# EAGLE design mbc_90_23_11_25_ac (EAGLE 7.6.0)

## Sheet 1 of 2
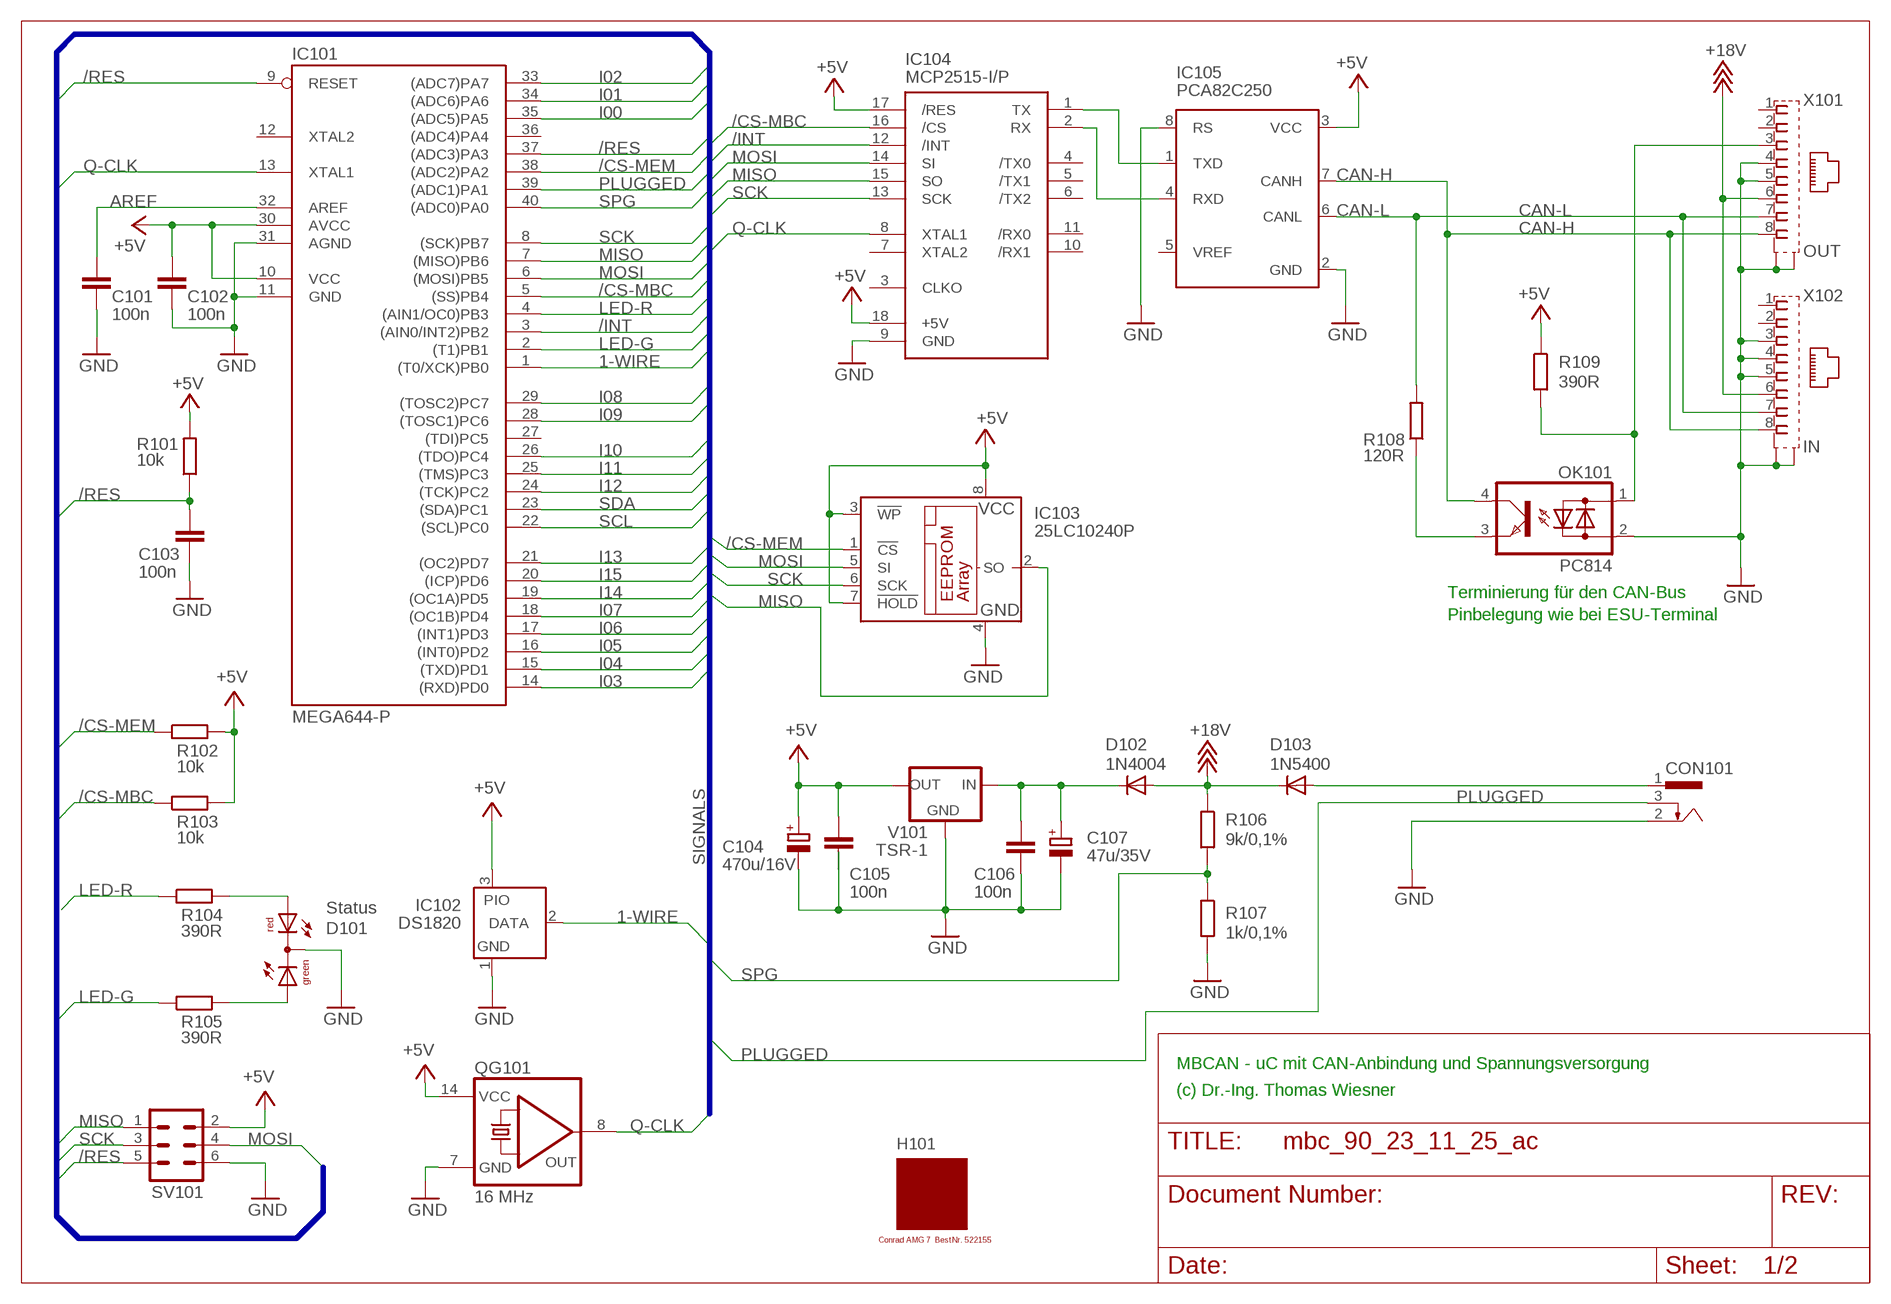
[diagram p0: schematic, sheet 1]

### Parts
C101  100n  C-EU025-025X050  [C025-025X050]
C102  100n  C-EU025-025X050  [C025-025X050]
C103  100n  C-EU025-025X050  [C025-025X050]
C104  470u/16V  CPOL-EUE3.5-8  [E3,5-8]
C105  100n  C-EU025-025X050  [C025-025X050]
C106  100n  C-EU025-025X050  [C025-025X050]
C107  47u/35V  CPOL-EUE2.5-7  [E2,5-7]
CON101  POWER-JACK  [POWER-JACK]
D101  Status  DUOLED5MM  [DUOLED5MM]
D102  1N4004  [DO41-10]
D103  1N5400  [DO201-15]
H101  MODULGEHÄUSE-AMG-7  [MODULGEHÄUSE-1]
IC101  MEGA644-P  MEGA323-P  [DIL40]
IC102  DS1820  DS2405  [TO92-]
IC103  25LC10240P  25LC040P  [DIL8]
IC104  MCP2515-I/P  MCP2510-I/P  [DIL18]
IC105  PCA82C250  [DIL08]
OK101  PC814  [DIL04]
QG101  16 MHz  QG5860  [DIL14S]
R101  10k  R-EU_0207/10  [0207/10]
R102  10k  R-EU_0207/10  [0207/10]
R103  10k  R-EU_0207/10  [0207/10]
R104  390R  R-EU_0207/10  [0207/10]
R105  390R  R-EU_0207/10  [0207/10]
R106  9k/0,1%  R-EU_0207/10  [0207/10]
R107  1k/0,1%  R-EU_0207/10  [0207/10]
R108  120R  R-EU_0207/10  [0207/10]
R109  390R  R-EU_0207/10  [0207/10]
SV101  ML6  [ML6]
V101  TSR-1  [TRACO-TSR-1]
X101  OUT  0446200002  [0446200002]
X102  IN  0446200002  [0446200002]

### Nets
1-WIRE: IC101.1((T0/XCK)PB0) IC102.2(DATA)
+5V: C102.1 C104.+ C105.1 IC101.10(VCC) IC101.30(AVCC) IC102.3(PIO) IC103.3(!WP) IC103.7(!HOLD) IC103.8(VCC) IC104.17(/RES) IC104.18(+5V) IC105.3(VCC) QG101.14(VCC) R101.2 R102.2 R103.2 R109.1 SV101.2 V101.OUT ; also sheet 2
+18V: D102.A D103.C R106.1 X101.6 X102.6
/CS-MBC: IC101.5((SS)PB4) IC104.16(/CS) R103.1
/CS-MEM: IC101.38((ADC2)PA2) IC103.1(!CS) R102.1
/INT: IC101.3((AIN0/INT2)PB2) IC104.12(/INT)
/RES: C103.1 IC101.9(RESET) IC101.37((ADC3)PA3) R101.1 SV101.5
AREF: C101.1 IC101.32(AREF)
CAN-H: IC105.7(CANH) OK101.4(C) X101.8 X102.8
CAN-L: IC105.6(CANL) R108.2 X101.7 X102.7
GND: C101.2 C102.2 C103.2 C104.- C105.2 C106.2 C107.- CON101.2 D101.K(C) IC101.11(GND) IC101.31(AGND) IC102.1(GND) IC103.4(GND) IC104.9(GND) IC105.2(GND) IC105.8(RS) QG101.7(GND) R107.2 SV101.6 V101.GND X101.4 X101.5 X101.S@1(S1) X101.S@2(S2) X102.3 X102.4 X102.5 X102.S@1(S1) X102.S@2(S2) ; also sheet 2
I00: IC101.35((ADC5)PA5) ; also sheet 2
I01: IC101.34((ADC6)PA6) ; also sheet 2
I02: IC101.33((ADC7)PA7) ; also sheet 2
I03: IC101.14((RXD)PD0) ; also sheet 2
I04: IC101.15((TXD)PD1) ; also sheet 2
I05: IC101.16((INT0)PD2) ; also sheet 2
I06: IC101.17((INT1)PD3) ; also sheet 2
I07: IC101.18((OC1B)PD4) ; also sheet 2
I08: IC101.29((TOSC2)PC7) ; also sheet 2
I09: IC101.28((TOSC1)PC6) ; also sheet 2
I10: IC101.26((TDO)PC4) ; also sheet 2
I11: IC101.25((TMS)PC3) ; also sheet 2
I12: IC101.24((TCK)PC2) ; also sheet 2
I13: IC101.21((OC2)PD7) ; also sheet 2
I14: IC101.19((OC1A)PD5) ; also sheet 2
I15: IC101.20((ICP)PD6) ; also sheet 2
LED-G: IC101.2((T1)PB1) R105.1
LED-R: IC101.4((AIN1/OC0)PB3) R104.1
MISO: IC101.7((MISO)PB6) IC103.2(SO) IC104.15(SO) SV101.1
MOSI: IC101.6((MOSI)PB5) IC103.5(SI) IC104.14(SI) SV101.4
N$1: IC104.1(TX) IC105.1(TXD)
N$2: IC104.2(RX) IC105.4(RXD)
N$4: OK101.3(E) R108.1
N$6: C106.1 C107.+ D102.C V101.IN
N$7: OK101.1(AC1) R109.2 X101.3
N$9: D101.AR R104.2
N$13: D101.AG R105.2
PLUGGED: CON101.3 IC101.39((ADC1)PA1)
Q-CLK: IC101.13(XTAL1) IC104.8(XTAL1) QG101.8(OUT)
SCK: IC101.8((SCK)PB7) IC103.6(SCK) IC104.13(SCK) SV101.3
SCL: IC101.22((SCL)PC0) ; also sheet 2
SDA: IC101.23((SDA)PC1) ; also sheet 2
SPG: IC101.40((ADC0)PA0) R106.2 R107.1
V-NETZTEIL1: CON101.1 D103.A
Unconnected: IC101.12(XTAL2) IC101.27((TDI)PC5) IC101.36((ADC4)PA4) IC104.3(CLKO) IC104.4(/TX0) IC104.5(/TX1) IC104.6(/TX2) IC104.7(XTAL2) IC104.10(/RX1) IC104.11(/RX0) IC105.5(VREF) OK101.2(AC2) X101.1 X101.2 X102.1 X102.2

### Buses
SIGNALS

### Notes on the sheet
- Terminierung für den CAN-Bus
- Pinbelegung wie bei ESU-Terminal
- MBCAN - uC mit CAN-Anbindung und Spannungsversorgung
- (c) Dr.-Ing. Thomas Wiesner

## Sheet 2 of 2
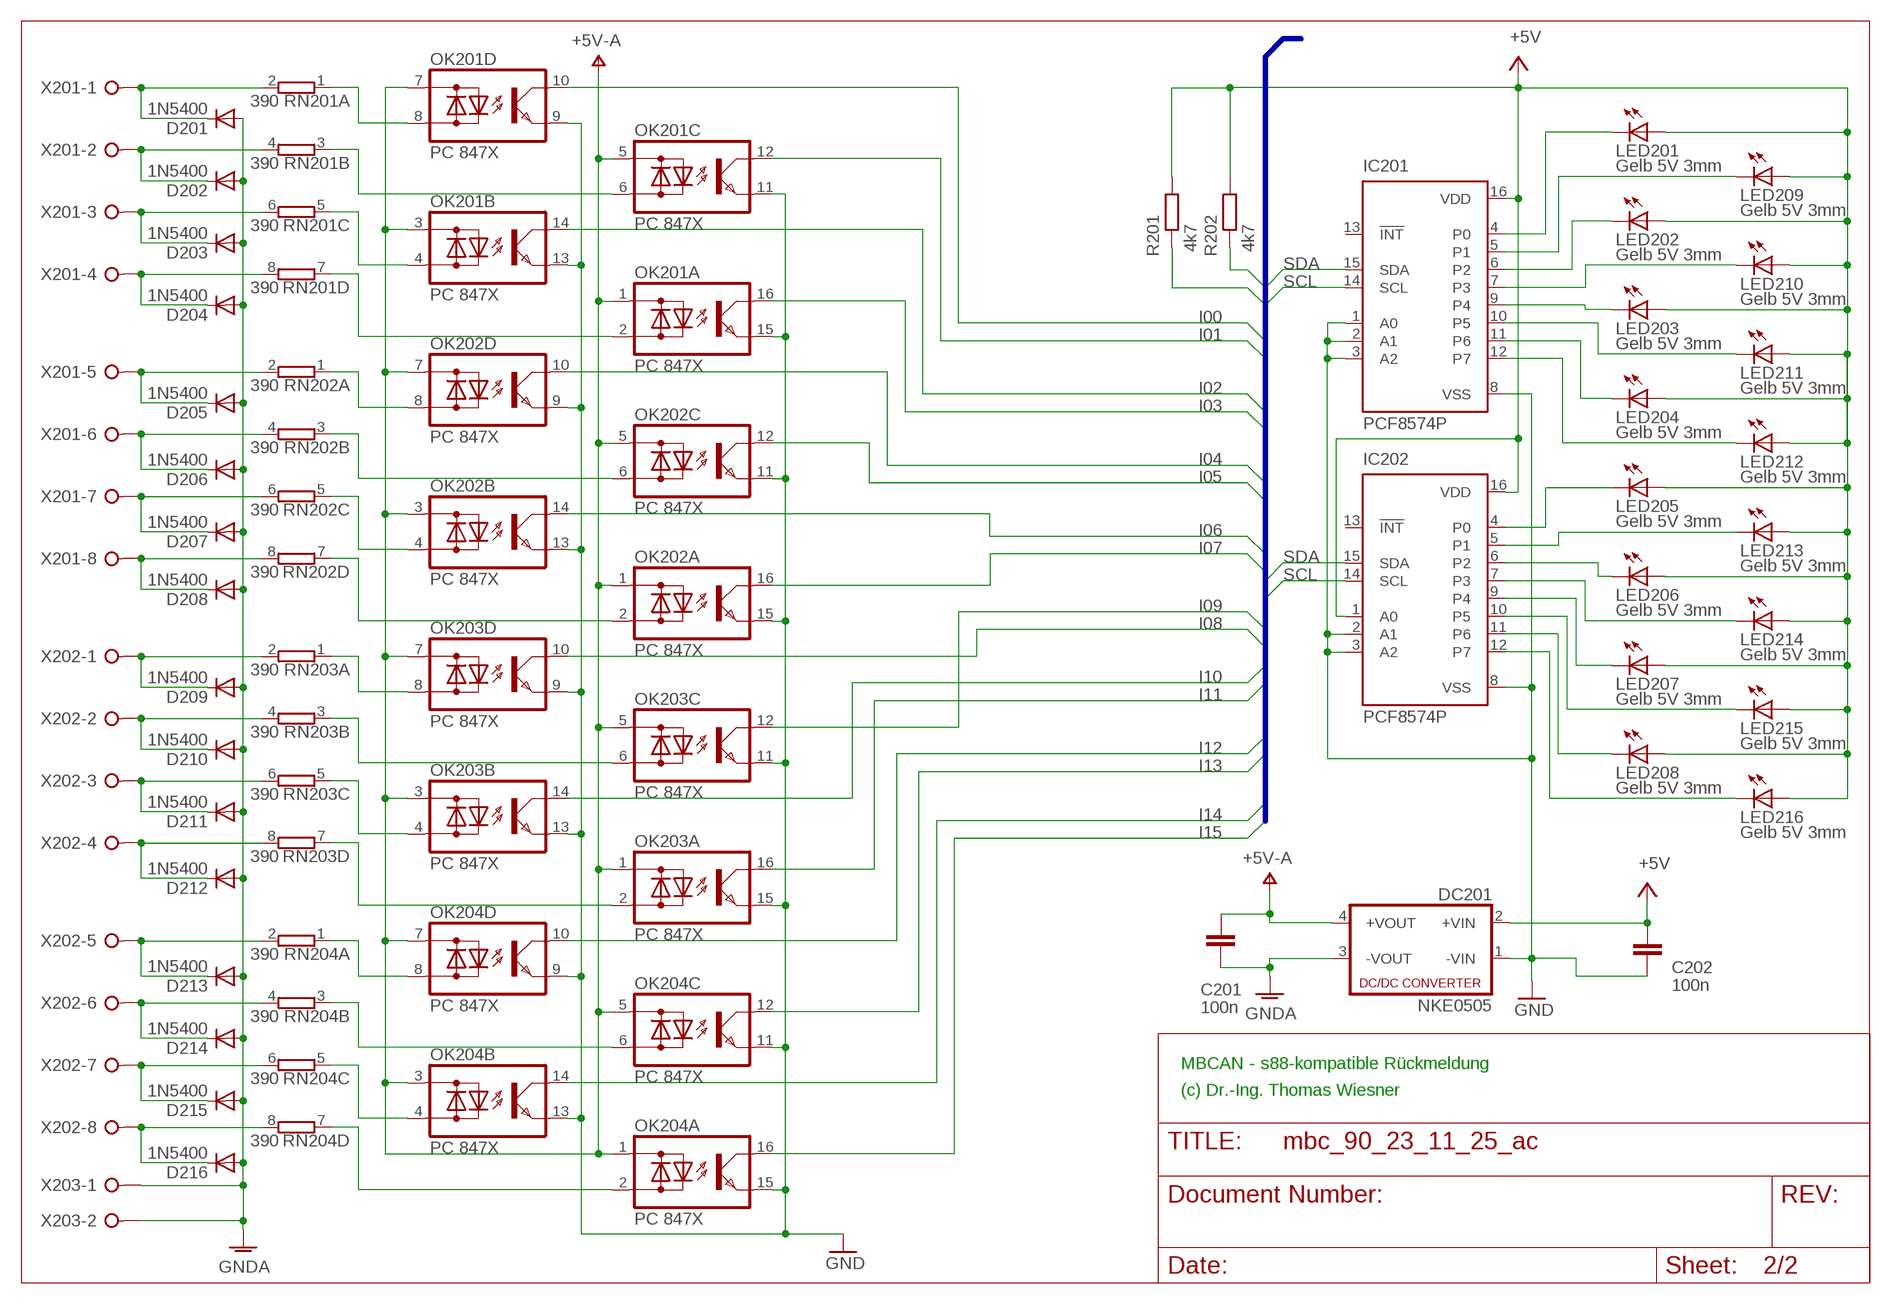
[diagram p1: schematic, sheet 2]

### Parts
C201  100n  C-EU025-025X050  [C025-025X050]
C202  100n  C-EU025-025X050  [C025-025X050]
D201  1N5400  [DO201-15]
D202  1N5400  [DO201-15]
D203  1N5400  [DO201-15]
D204  1N5400  [DO201-15]
D205  1N5400  [DO201-15]
D206  1N5400  [DO201-15]
D207  1N5400  [DO201-15]
D208  1N5400  [DO201-15]
D209  1N5400  [DO201-15]
D210  1N5400  [DO201-15]
D211  1N5400  [DO201-15]
D212  1N5400  [DO201-15]
D213  1N5400  [DO201-15]
D214  1N5400  [DO201-15]
D215  1N5400  [DO201-15]
D216  1N5400  [DO201-15]
DC201  NKE0505  NME  [NME]
IC201  PCF8574P  [DIL16]
IC202  PCF8574P  [DIL16]
LED201  Gelb 5V 3mm  LED3MM  [LED3MM]
LED202  Gelb 5V 3mm  LED3MM  [LED3MM]
LED203  Gelb 5V 3mm  LED3MM  [LED3MM]
LED204  Gelb 5V 3mm  LED3MM  [LED3MM]
LED205  Gelb 5V 3mm  LED3MM  [LED3MM]
LED206  Gelb 5V 3mm  LED3MM  [LED3MM]
LED207  Gelb 5V 3mm  LED3MM  [LED3MM]
LED208  Gelb 5V 3mm  LED3MM  [LED3MM]
LED209  Gelb 5V 3mm  LED3MM  [LED3MM]
LED210  Gelb 5V 3mm  LED3MM  [LED3MM]
LED211  Gelb 5V 3mm  LED3MM  [LED3MM]
LED212  Gelb 5V 3mm  LED3MM  [LED3MM]
LED213  Gelb 5V 3mm  LED3MM  [LED3MM]
LED214  Gelb 5V 3mm  LED3MM  [LED3MM]
LED215  Gelb 5V 3mm  LED3MM  [LED3MM]
LED216  Gelb 5V 3mm  LED3MM  [LED3MM]
OK201  PC 847X  TIL196  [DIL16]
OK202  PC 847X  TIL196  [DIL16]
OK203  PC 847X  TIL196  [DIL16]
OK204  PC 847X  TIL196  [DIL16]
R201  4k7  R-EU_0207/10  [0207/10]
R202  4k7  R-EU_0207/10  [0207/10]
RN201  390  E4R  [SIL8]
RN202  390  E4R  [SIL8]
RN203  390  E4R  [SIL8]
RN204  390  E4R  [SIL8]
X201  W237-08P  [W237-8P]
X202  W237-08P  [W237-8P]
X203  W237-02P  [W237-132]

### Nets
+5V: C202.1 DC201.2(+VIN) IC201.16(VDD) IC202.1(A0) IC202.16(VDD) LED201.A LED202.A LED203.A LED204.A LED205.A LED206.A LED207.A LED208.A LED209.A LED210.A LED211.A LED212.A LED213.A LED214.A LED215.A LED216.A R201.2 R202.2 ; also sheet 1
GND: C202.2 DC201.1(-VIN) IC201.1(A0) IC201.2(A1) IC201.3(A2) IC201.8(VSS) IC202.2(A1) IC202.3(A2) IC202.8(VSS) OK201.9(D:E) OK201.11(C:E) OK201.13(B:E) OK201.15(A:E) OK202.9(D:E) OK202.11(C:E) OK202.13(B:E) OK202.15(A:E) OK203.9(D:E) OK203.11(C:E) OK203.13(B:E) OK203.15(A:E) OK204.9(D:E) OK204.11(C:E) OK204.13(B:E) OK204.15(A:E) ; also sheet 1
GNDA: C201.2 D201.A D202.A D203.A D204.A D205.A D206.A D207.A D208.A D209.A D210.A D211.A D212.A D213.A D214.A D215.A D216.A DC201.3(-VOUT) X203.1 X203.2
I00: OK201.10(D:C) ; also sheet 1
I01: OK201.12(C:C) ; also sheet 1
I02: OK201.14(B:C) ; also sheet 1
I03: OK201.16(A:C) ; also sheet 1
I04: OK202.10(D:C) ; also sheet 1
I05: OK202.12(C:C) ; also sheet 1
I06: OK202.14(B:C) ; also sheet 1
I07: OK202.16(A:C) ; also sheet 1
I08: OK203.10(D:C) ; also sheet 1
I09: OK203.12(C:C) ; also sheet 1
I10: OK203.14(B:C) ; also sheet 1
I11: OK203.16(A:C) ; also sheet 1
I12: OK204.10(D:C) ; also sheet 1
I13: OK204.12(C:C) ; also sheet 1
I14: OK204.14(B:C) ; also sheet 1
I15: OK204.16(A:C) ; also sheet 1
N$15: IC201.9(P4) LED203.K(C)
N$16: D215.C RN204.6 X202.7
N$17: D216.C RN204.8 X202.8
N$18: D213.C RN204.2 X202.5
N$19: D214.C RN204.4 X202.6
N$20: D211.C RN203.6 X202.3
N$21: D212.C RN203.8 X202.4
N$22: D209.C RN203.2 X202.1
N$23: D210.C RN203.4 X202.2
N$24: D207.C RN202.6 X201.7
N$25: D208.C RN202.8 X201.8
N$26: D205.C RN202.2 X201.5
N$27: D206.C RN202.4 X201.6
N$28: D203.C RN201.6 X201.3
N$29: D204.C RN201.8 X201.4
N$30: D201.C RN201.2 X201.1
N$31: IC201.10(P5) LED211.K(C)
N$32: OK204.2(A:AC2) RN204.7
N$35: OK204.4(B:AC2) RN204.5
N$36: OK204.6(C:AC2) RN204.3
N$37: OK204.8(D:AC2) RN204.1
N$38: OK203.2(A:AC2) RN203.7
N$39: OK203.4(B:AC2) RN203.5
N$40: OK203.6(C:AC2) RN203.3
N$41: OK203.8(D:AC2) RN203.1
N$42: OK202.2(A:AC2) RN202.7
N$43: OK202.4(B:AC2) RN202.5
N$44: OK202.6(C:AC2) RN202.3
N$45: OK202.8(D:AC2) RN202.1
N$46: OK201.2(A:AC2) RN201.7
N$47: D202.C RN201.4 X201.2
N$48: OK201.4(B:AC2) RN201.5
N$49: IC202.4(P0) LED205.K(C)
N$50: IC201.4(P0) LED201.K(C)
N$51: IC201.5(P1) LED209.K(C)
N$52: IC201.6(P2) LED202.K(C)
N$53: IC201.7(P3) LED210.K(C)
N$54: IC201.11(P6) LED204.K(C)
N$55: IC201.12(P7) LED212.K(C)
N$56: IC202.9(P4) LED207.K(C)
N$57: IC202.5(P1) LED213.K(C)
N$58: IC202.6(P2) LED206.K(C)
N$59: IC202.7(P3) LED214.K(C)
N$60: IC202.10(P5) LED215.K(C)
N$61: IC202.11(P6) LED208.K(C)
N$62: IC202.12(P7) LED216.K(C)
N$64: OK201.6(C:AC2) RN201.3
N$65: OK201.8(D:AC2) RN201.1
SCL: IC201.14(SCL) IC202.14(SCL) R201.1 ; also sheet 1
SDA: IC201.15(SDA) IC202.15(SDA) R202.1 ; also sheet 1
V+: C201.1 DC201.4(+VOUT) OK201.1(A:AC1) OK201.3(B:AC1) OK201.5(C:AC1) OK201.7(D:AC1) OK202.1(A:AC1) OK202.3(B:AC1) OK202.5(C:AC1) OK202.7(D:AC1) OK203.1(A:AC1) OK203.3(B:AC1) OK203.5(C:AC1) OK203.7(D:AC1) OK204.1(A:AC1) OK204.3(B:AC1) OK204.5(C:AC1) OK204.7(D:AC1) ; supply symbol labelled +5V-A
Unconnected: IC201.13(!INT) IC202.13(!INT)

### Buses
B$1

### Notes on the sheet
- MBCAN - s88-kompatible Rückmeldung
- (c) Dr.-Ing. Thomas Wiesner

## Library data of the parts
C101-C103 C105 C106 C201 C202 = rcl:C-EU: CAPACITOR, European symbol
C104 C107 = rcl:CPOL-EU: POLARIZED CAPACITOR, European symbol
CON101 = mbc:POWER-JACK: Power-Stecker für 2,5 mm Hohlbuchse
D101 = led:DUOLED5MM: DUO LED 2 colors, 5 mm, round
D102 = diode:1N4004: DIODE general purpose rectifier, 1 A
D103 D201-D216 = diode:1N5400: DIODE standard rectifier, 3 A, 50 V (Motorola)
DC201 = dc-dc-converter:NME: DC-DC CONVERTER; MF: C & D TECHNOLOGIES, INC; MPN: NME1205D; OC_FARNELL: 1021466; OC_NEWARK: 98B8198
H101 = mbc:MODULGEHÄUSE-AMG-7: Gehäuse Conrad AMG 7 BestNr. 522155
IC101 = atmel:MEGA323-P: MICROCONTROLLER 32 Kbytes FLASH 2 Kbytes SRAM 1 Kbytes EEPROM USART 8-channel 10 bit ADC Source: avr.lbr; OC_FARNELL: unknown; OC_NEWARK: unknown
IC102 = maxim:DS2405: Addressable Switch DALLAS Semiconductor; MF: DALLAS SEMICONDUCTOR; MPN: DS2405; OC_FARNELL: 1188025; OC_NEWARK: 06F4645
IC103 = microchip:25*: Serial EEPROM 4K/ 8K , SPI bus; MF: MICROCHIP; MPN: 25LC040/P; OC_FARNELL: 9758100; OC_NEWARK: 96K4091
IC104 = mbc:MCP2510: BASIC-CAN 2.0a Controller Stand-alone CAN controller von Microchip
IC105 = micro-philips:PCA82C250: CAN CONTROLLER INTERFACE; OC_FARNELL: 3692358; OC_NEWARK: unknown
IC201 IC202 = micro-philips:PCF8574: I2C-Bus Remote 8-bit I/O expander http://www.semiconductors.philips.com/acrobat_download/datasheets/PCF8574_4.pdf; MPN: PCF8574PN; OC_FARNELL: 204020; OC_NEWARK: 11N8515
LED201-LED216 = led:LED: LED OSRAM: - CHIPLED LG R971, LG N971, LY N971, LG Q971, LY Q971, LO R971, LY R971 LH N974, LH R974 LS Q976, LO Q976, LY Q976 LO Q996 - Hyper CHIPLED LW Q18S LB Q993, LB Q99A, LB R99A - SideLED LS A670, LO A670, LY A670, LG A670, LP A670 LB A673, LV A673, LT A673, LW A673 LH A674 LY A675 LS A676, LA A676, LO A676, LY A676, LW A676 LS A679, LY A679, LG A679 - Hyper Micro SIDELED® LS Y876, LA Y876, LO Y876, LY Y876 LT Y87S - SmartLED LW L88C, LW L88S LB L89C, LB L89S, LG L890 LS L89K, LO L89K, LY L89K LS L896, LA L896, LO L896, LY L896 - TOPLED LS T670, LO T670, LY T670, LG T670, LP T670 LSG T670, LSP T670, LSY T670, LOP T670, LYG T670 LG T671, LOG T671, LSG T671 LB T673, LV T673, LT T673, LW T673 LH T674 LS T676, LA T676, LO T676, LY T676, LB T676, LH T676, LSB T676, LW T676 LB T67C, LV T67C, LT T67C, LS T67K, LO T67K, LY T67K, LW E67C LS E67B, LA E67B, LO E67B, LY E67B, LB E67C, LV E67C, LT E67C LW T67C LS T679, LY T679, LG T679 LS T770, LO T770, LY T770, LG T770, LP T770 LB T773, LV T773, LT T773, LW T773 LH T774 LS E675, LA E675, LY E675, LS T675 LS T776, LA T776, LO T776, LY T776, LB T776 LHGB T686 LT T68C, LB T68C - Hyper Mini TOPLED® LB M676 - Mini TOPLED Santana® LG M470 LS M47K, LO M47K, LY M47K Source: http://www.osram.convergy.de LUXEON: - LUMILED® LXK2-PW12-R00, LXK2-PW12-S00, LXK2-PW14-U00, LXK2-PW14-V00 LXK2-PM12-R00, LXK2-PM12-S00, LXK2-PM14-U00 LXK2-PE12-Q00, LXK2-PE12-R00, LXK2-PE12-S00, LXK2-PE14-T00, LXK2-PE14-U00 LXK2-PB12-K00, LXK2-PB12-L00, LXK2-PB12-M00, LXK2-PB14-N00, LXK2-PB14-P00, LXK2-PB14-Q00 LXK2-PR12-L00, LXK2-PR12-M00, LXK2-PR14-Q00, LXK2-PR14-R00 LXK2-PD12-Q00, LXK2-PD12-R00, LXK2-PD12-S00 LXK2-PH12-R00, LXK2-PH12-S00 LXK2-PL12-P00, LXK2-PL12-Q00, LXK2-PL12-R00 Source: www.luxeon.com KINGBRIGHT: KA-3528ASYC Source: www.kingbright.com
OK101 = optocoupler:PC814: SHARP OPTO COUPLER; OC_FARNELL: 9707662; OC_NEWARK: unknown
OK201-OK204 = optocoupler:TIL196: TEXAS INSTRUMENTS OPTO COUPLER; MPN: TIL 196; OC_FARNELL: 1683367; OC_NEWARK: 05R6476
QG101 = crystal:QG5860: CRYSTAL RESONATOR; OC_FARNELL: unknown; OC_NEWARK: unknown
R101-R109 R201 R202 = resistor:R-EU_: RESISTOR, European symbol
RN201-RN204 = resistor-sil:E4R: SIL RESISTOR; OC_FARNELL: unknown; OC_NEWARK: unknown
SV101 = con-ml:ML6: HARTING; OC_FARNELL: unknown; OC_NEWARK: unknown
V101 = mbc:TSR-1: Spannungsregler Hersteller: TRACO Typ: TSR-1 5V: TSR 1-2450 Spg: 5V Strom: 1A Reichelt TSR 1-2450
X101 X102 = mbc:0446200002: RJ-45 INVERTED MODULAR JACK ASSEMBLY WITH RJ-11 KEEPOUT FEATURE Source: Data sheet <http://www.farnell.com/datasheets/73207.pdf> MOLEX 0446200002 BUCHSE, RJ45, GESCHIRMT Source: Farnell <http://de.farnell.com/molex/0446200002/buchse-rj45-geschirmt/dp/9251910?ost=9251910>; MF: MOLEX; MPN: 0446200002; OC_FARNELL: 9251910
X201 X202 = con-wago-508:W237-08P: WAGO SREW CLAMP; OC_FARNELL: unknown; OC_NEWARK: unknown
X203 = con-wago-508:W237-02P: WAGO SREW CLAMP; OC_FARNELL: unknown; OC_NEWARK: unknown

## Board
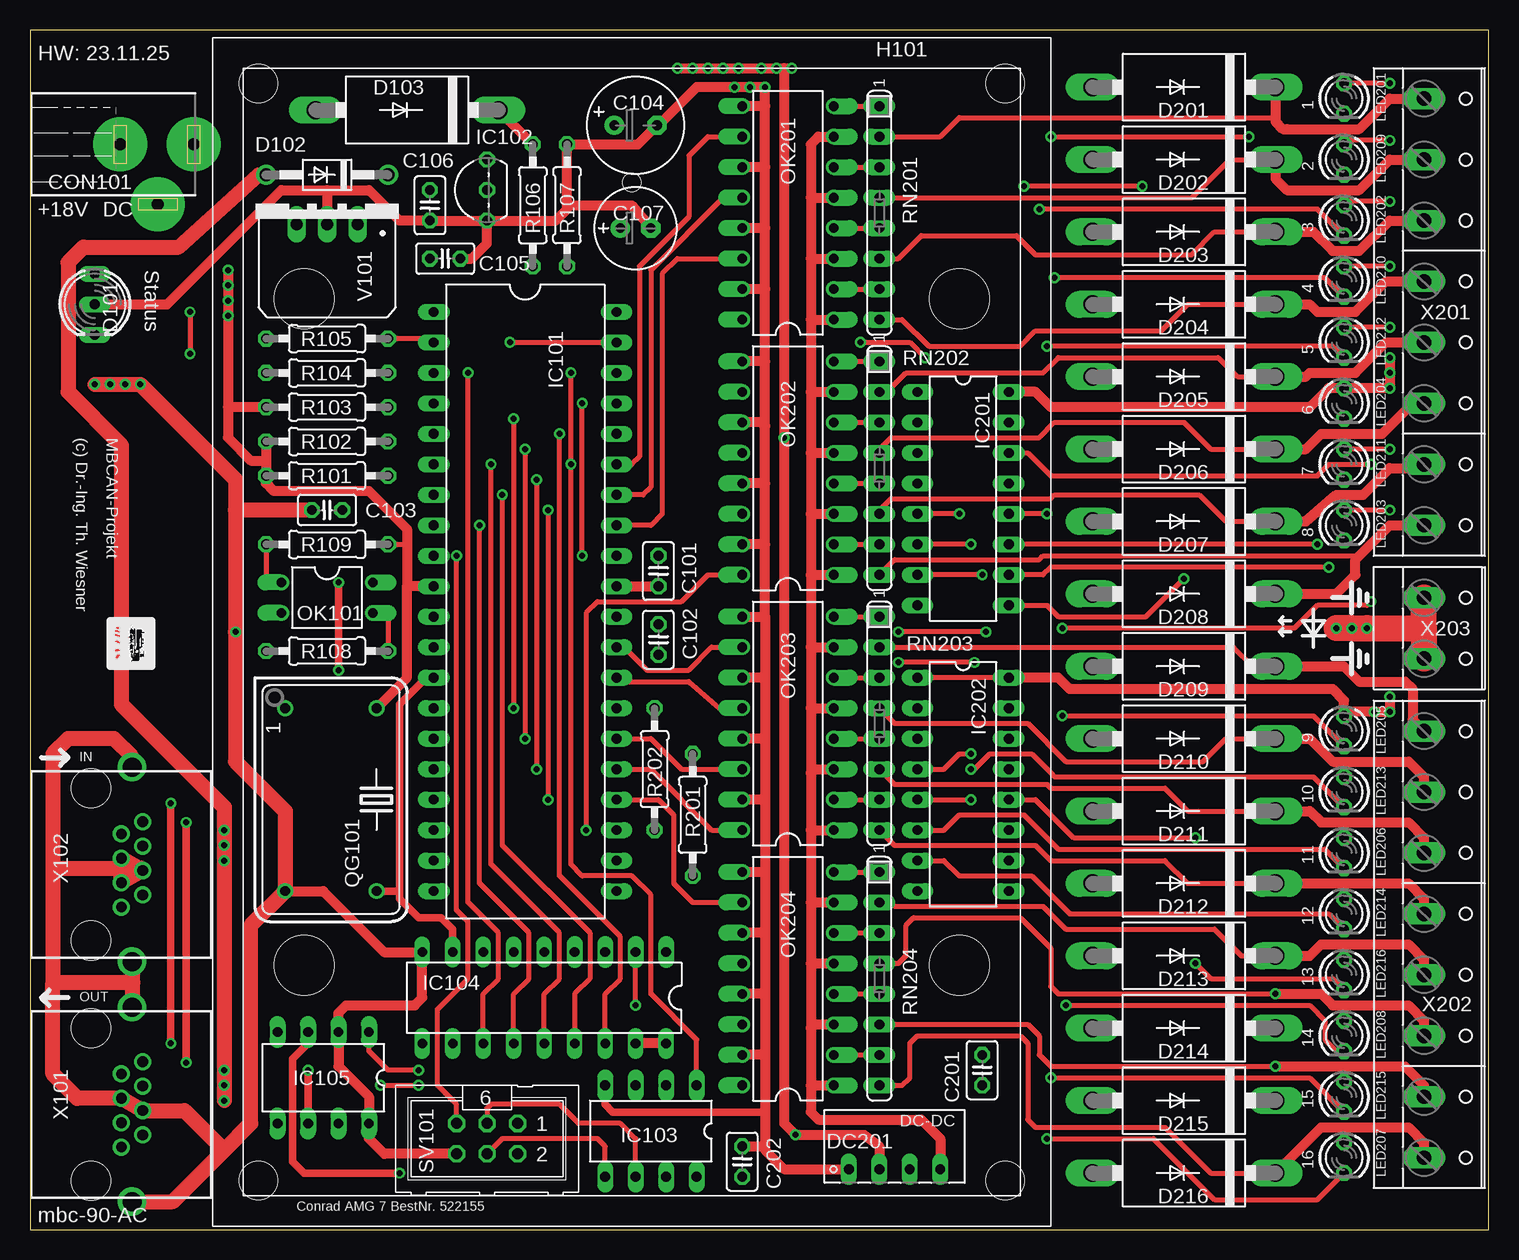
[diagram p2: board, top side]
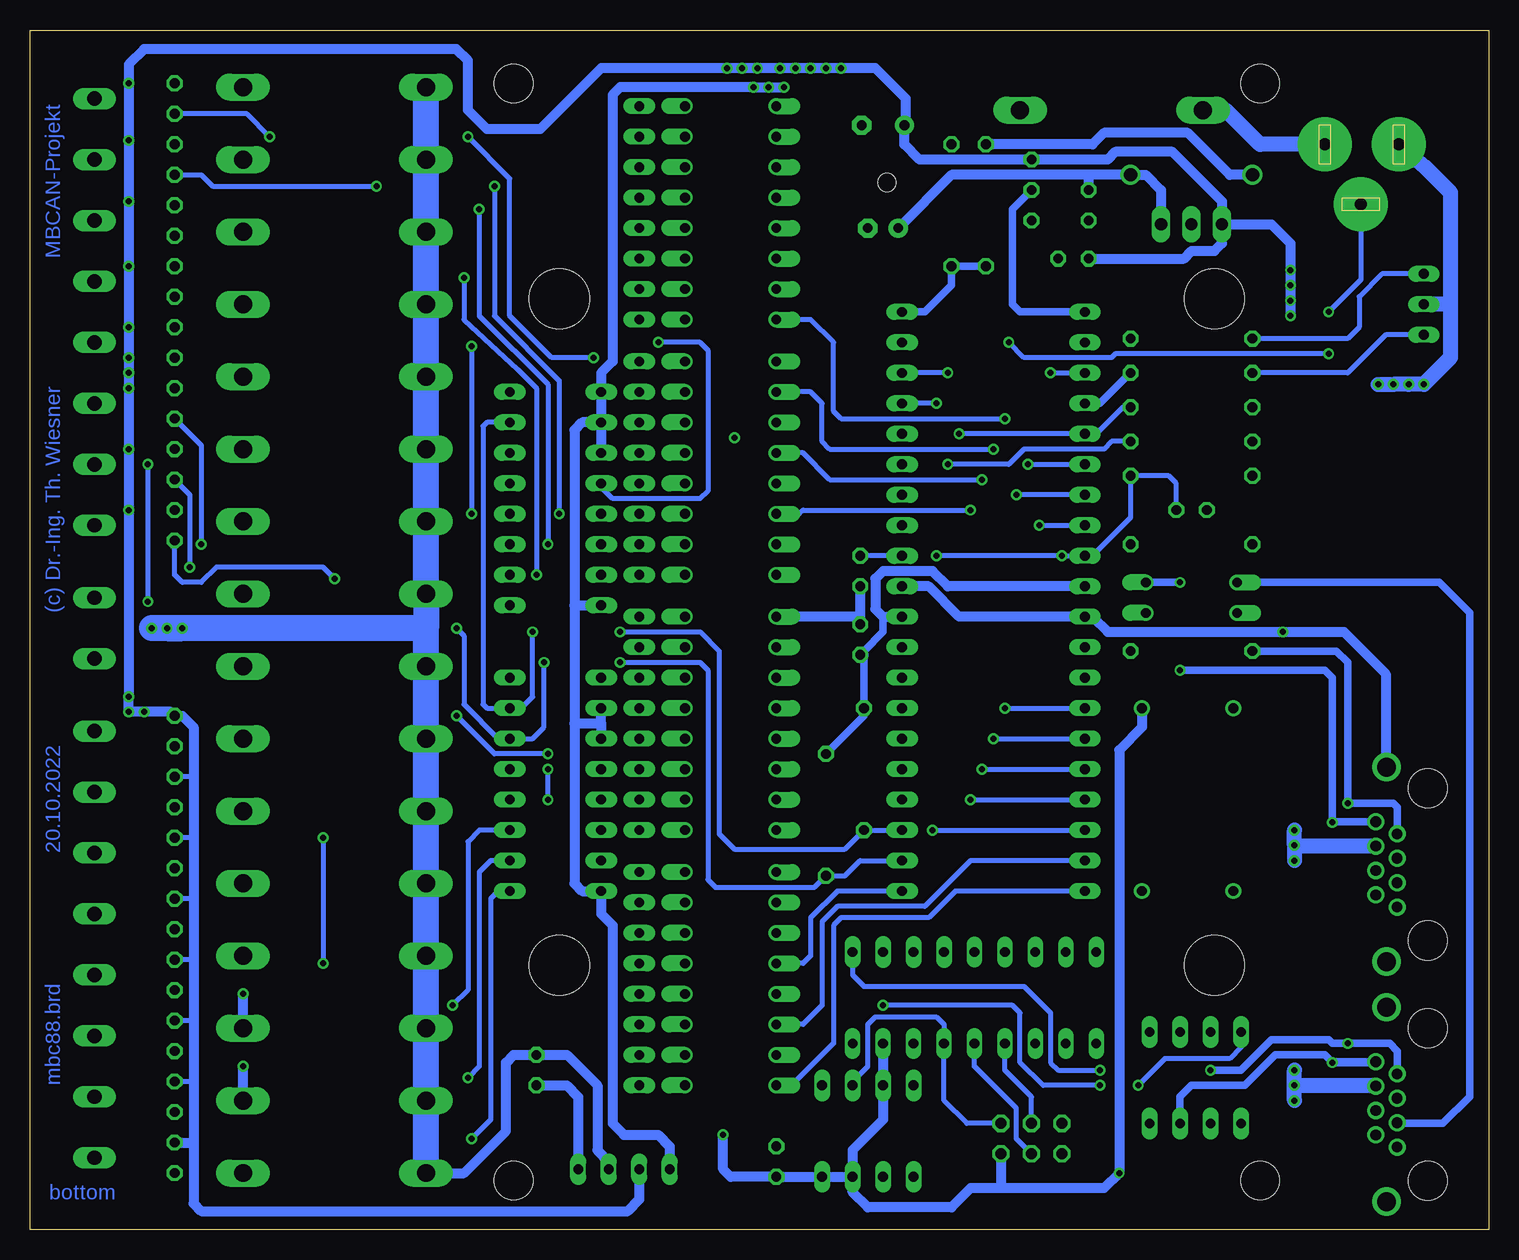
[diagram p3: board, bottom side, seen from below]

Size 121.59 x 99.99 mm. Coordinates in mm from the lower left corner, seen from the top.
Outline: 0,99.99 0,0 121.59,0 121.59,99.99 0,99.99
Copper layers (1*16): Top 0.035mm / dielectric 1.5mm / Bottom 0.035mm
Design rules "default *": minimum track width 10mil, minimum drill 0.5mm, track to track 8mil, track to pad 8mil, pad to pad 8mil, via to via 8mil, smd to smd 8mil, copper to edge 40mil, drill to drill 8mil, minimum pad ring 10mil, minimum via ring 8mil, stop-mask expansion 4mil, vias tented up to drill 0mil, thermal gap 10mil

### Footprints (pad centres in the part's own frame; a part is rotated, then mirrored left to right if it is on the bottom)
C025-025X050 = drill 0.813 octagon: 1 -1.27,0; 2 1.27,0
E3,5-8 = drill 0.813 pad 1.6: + -1.778,0 | drill 0.813 pad 1.6 octagon: - 1.778,0
E2,5-7 = drill 0.813 pad 1.6: + -1.27,0 | drill 0.813 pad 1.6 octagon: - 1.27,0
POWER-JACK = drill 1 pad 4.5: 1 0,6.03; 2 0,-0.12; 3 5,3.03
DUOLED5MM = drill 0.813 long: AG -2.54,0; AR 2.54,0; K 0,0
DO41-10 = drill 1.118: A 5.08,0; C -5.08,0
DO201-15 = drill 1.499 long: A 7.62,0; C -7.62,0
NME = drill 0.813 long: 1 0,3.81; 2 0,1.27; 3 0,-1.27; 4 0,-3.81
MODULGEHÄUSE-1 = hole 3.2: -45.72,-31.115; -45.72,31.115; 45.72,31.115; 45.72,-31.115 | hole 5: -27.781,-27.305; 27.781,-27.305; -27.781,27.305; 27.781,27.305 | hole 1.5: -37.465,0
DIL40 = drill 0.813 long: 1 -24.13,-7.62; 2 -21.59,-7.62; 3 -19.05,-7.62; 4 -16.51,-7.62; 5 -13.97,-7.62; 6 -11.43,-7.62; 7 -8.89,-7.62; 8 -6.35,-7.62; 9 -3.81,-7.62; 10 -1.27,-7.62; 11 1.27,-7.62; 12 3.81,-7.62; 13 6.35,-7.62; 14 8.89,-7.62; 15 11.43,-7.62; 16 13.97,-7.62; 17 16.51,-7.62; 18 19.05,-7.62; 19 21.59,-7.62; 20 24.13,-7.62; 21 24.13,7.62; 22 21.59,7.62; 23 19.05,7.62; 24 16.51,7.62; 25 13.97,7.62; 26 11.43,7.62; 27 8.89,7.62; 28 6.35,7.62; 29 3.81,7.62; 30 1.27,7.62; 31 -1.27,7.62; 32 -3.81,7.62; 33 -6.35,7.62; 34 -8.89,7.62; 35 -11.43,7.62; 36 -13.97,7.62; 37 -16.51,7.62; 38 -19.05,7.62; 39 -21.59,7.62; 40 -24.13,7.62
TO92- = drill 0.813 octagon: 1 -2.54,0; 2 0,0; 3 2.54,0
DIL8 = drill 0.813 long: 1 -3.81,-3.81; 2 -1.27,-3.81; 3 1.27,-3.81; 4 3.81,-3.81; 5 3.81,3.81; 6 1.27,3.81; 7 -1.27,3.81; 8 -3.81,3.81
DIL18 = drill 0.813 long: 1 -10.16,-3.81; 2 -7.62,-3.81; 3 -5.08,-3.81; 4 -2.54,-3.81 | drill 0.8 long: 5 0,-3.81; 6 2.54,-3.81; 7 5.08,-3.81; 8 7.62,-3.81; 9 10.16,-3.81; 10 10.16,3.81; 11 7.62,3.81; 12 5.08,3.81; 13 2.54,3.81; 14 0,3.81; 15 -2.54,3.81; 16 -5.08,3.81; 17 -7.62,3.81; 18 -10.16,3.81
DIL08 = drill 0.813 long: 1 -3.81,-3.81; 2 -1.27,-3.81; 3 1.27,-3.81; 4 3.81,-3.81; 5 3.81,3.81; 6 1.27,3.81; 7 -1.27,3.81; 8 -3.81,3.81
DIL16 = drill 0.813 long: 1 -8.89,-3.81; 2 -6.35,-3.81; 3 -3.81,-3.81; 4 -1.27,-3.81; 5 1.27,-3.81; 6 3.81,-3.81; 7 6.35,-3.81; 8 8.89,-3.81; 9 8.89,3.81; 10 6.35,3.81; 11 3.81,3.81; 12 1.27,3.81; 13 -1.27,3.81; 14 -3.81,3.81; 15 -6.35,3.81; 16 -8.89,3.81
LED3MM = drill 0.813 octagon: A -1.27,0; K 1.27,0
DIL04 = drill 0.813 offset: 1 -1.27,-3.81; 2 1.27,-3.81; 3 1.27,3.81; 4 -1.27,3.81
DIL16' = drill 0.813 offset: 1 -8.89,-3.81; 2 -6.35,-3.81; 3 -3.81,-3.81; 4 -1.27,-3.81; 5 1.27,-3.81; 6 3.81,-3.81; 7 6.35,-3.81; 8 8.89,-3.81; 9 8.89,3.81; 10 6.35,3.81; 11 3.81,3.81; 12 1.27,3.81; 13 -1.27,3.81; 14 -3.81,3.81; 15 -6.35,3.81; 16 -8.89,3.81
DIL14S = drill 0.813: 1 -7.62,-3.81; 7 7.62,-3.81; 8 7.62,3.81; 14 -7.62,3.81
0207/10 = drill 0.813 octagon: 1 -5.08,0; 2 5.08,0
SIL8 = drill 0.813 long: 1 -8.89,0; 2 -6.35,0; 3 -3.81,0; 4 -1.27,0; 5 1.27,0; 6 3.81,0; 7 6.35,0; 8 8.89,0
ML6 = drill 0.914 octagon: 1 -2.54,-1.27; 2 -2.54,1.27; 3 0,-1.27; 4 0,1.27; 5 2.54,-1.27; 6 2.54,1.27
TRACO-TSR-1 = drill 1.016 long: GND 0,2.54; IN -2.54,2.54; OUT 2.54,2.54
0446200002 = drill 0.889 pad 1.422: 1 3.556,2.54; 2 2.54,4.318; 3 1.524,2.54; 4 0.508,4.318; 5 -0.508,2.54; 6 -1.524,4.318; 7 -2.54,2.54; 8 -3.556,4.318 | drill 1.575 pad 2.286: S@1 -8.103,3.429; S@2 8.103,3.429 | hole 3.251: 6.35,0; -6.35,0
W237-8P = drill 1.194 long: 1 -17.78,-0.635; 2 -12.7,-0.635; 3 -7.62,-0.635; 4 -2.54,-0.635; 5 2.54,-0.635; 6 7.62,-0.635; 7 12.7,-0.635; 8 17.78,-0.635
W237-132 = drill 1.194 long: 1 -2.54,-0.635; 2 2.54,-0.635

### Placement (x,y rotation side)
C101  52.39,54.91 270 top
C102  52.39,49.19 90 top
C103  24.77,59.99 180 top
C104  50.48,92.06 0 top
C105  34.61,80.94 0 top
C106  33.34,85.39 270 top
C107  50.48,83.48 0 top
C201  79.38,13.32 90 top
C202  59.37,5.7 90 top
CON101  7.62,90.47 270 top
D101  5.4,77.13 270 top
D102  24.77,87.93 180 top
D103  31.43,93.33 180 top
D201  96.2,95.23 180 top
D202  96.2,89.2 180 top
D203  96.2,83.17 180 top
D204  96.2,77.13 180 top
D205  96.2,71.1 180 top
D206  96.2,65.07 180 top
D207  96.2,59.03 180 top
D208  96.2,53 180 top
D209  96.2,46.97 180 top
D210  96.2,40.94 180 top
D211  96.2,34.9 180 top
D212  96.2,28.87 180 top
D213  96.2,22.84 180 top
D214  96.2,16.81 180 top
D215  96.2,10.78 180 top
D216  96.2,4.74 180 top
DC201  72.07,5.06 90 top
H101  50.16,49.83 270 top
IC101  41.27,52.37 270 top
IC102  38.1,86.66 90 top
IC103  51.75,8.24 180 top
IC104  42.86,19.35 180 top
IC105  24.45,12.68 180 top
IC201  77.79,60.94 270 top
IC202  77.79,37.13 270 top
LED201  109.54,94.28 270 top
LED202  109.54,84.12 270 top
LED203  109.54,58.72 270 top
LED204  109.54,68.88 270 top
LED205  109.54,41.57 270 top
LED206  109.54,31.41 270 top
LED207  109.54,6.01 270 top
LED208  109.54,16.17 270 top
LED209  109.54,89.2 270 top
LED210  109.54,79.04 270 top
LED211  109.54,63.8 270 top
LED212  109.54,73.96 270 top
LED213  109.54,36.49 270 top
LED214  109.54,26.33 270 top
LED215  109.54,11.09 270 top
LED216  109.54,21.25 270 top
OK101  24.77,52.68 270 top
OK201  PC 847X  [DIL16']  63.18,84.75 90 top
OK202  PC 847X  [DIL16']  63.18,63.48 90 top
OK203  PC 847X  [DIL16']  63.18,42.21 90 top
OK204  PC 847X  [DIL16']  63.18,20.93 90 top
QG101  25.08,35.86 270 top
R101  24.77,62.84 180 top
R102  24.77,65.7 180 top
R103  24.77,68.56 180 top
R104  24.77,71.42 180 top
R105  24.77,74.28 180 top
R106  41.91,85.39 270 top
R107  44.77,85.39 90 top
R108  24.77,48.24 180 top
R109  24.77,57.13 180 top
R201  55.24,34.59 90 top
R202  52.07,38.4 90 top
RN201  70.8,84.75 270 top
RN202  70.8,63.48 270 top
RN203  70.8,42.21 270 top
RN204  70.8,20.93 270 top
SV101  38.1,7.6 180 top
V101  24.77,86.34 180 top
X101  5.08,10.46 270 top
X102  5.08,30.46 270 top
X201  116.84,76.5 270 top
X202  116.84,23.79 270 top
X203  116.84,50.14 270 top

### Tracks (layer width: path | path; a pad name or v marks a point on that pad's centre or on a via)
1-WIRE
  Bottom 0.61: IC102.2 39.69,85.07 39.69,77.13 39.05,76.5 IC101.1
+5V  (via drill 0.5)
  Top 0.406: v113.35,95.55 LED201.A | LED209.A 109.54,90.79 v113.35,90.79 | LED202.A 109.54,85.7 v113.35,85.7 | v113.35,80.31 LED210.A | v113.35,65.07 LED211.A | v113.35,59.99 LED203.A | IC202.16 IC202.1 | v113.35,75.23 LED212.A | R109.1 31.43,57.13
  Top 0.61: IC105.3 23.18,15.54 21.91,14.27 21.91,5.7 22.86,4.74 v30.8,4.74
  Top 0.813: IC104.18 IC104.17 | 31.43,53.64 31.43,57.13 31.43,58.4 28.26,61.57 20.32,61.57 19.68,62.21 R101.2 19.68,64.12 | v16.51,79.99 v16.51,78.72 v16.51,77.45 v16.51,76.18 16.51,68.56 | 16.51,68.56 16.51,66.02 18.41,64.12 19.68,64.12 | IC101.10 31.43,53.64 | v53.98,96.82 v55.24,96.82 v56.52,96.82 v57.78,96.82 v59.05,96.82 v60.96,96.82 v62.23,96.82 62.87,96.82 | 62.87,96.82 v63.5,96.82 | IC202.16 85.72,46.02 86.68,45.06 108.58,45.06 109.54,44.11 LED205.A 109.54,43.16 v112.08,43.16 v113.35,43.16 v113.35,44.43 | v113.35,72.69 v113.35,71.42 v113.35,70.15 LED204.A 108.27,70.15 106.68,68.56 85.09,68.56 83.82,69.83 IC201.16 | 62.87,96.82 v62.87,66.02 62.87,8.87 v63.82,7.92 69.53,7.92 70.8,6.97 DC201.2 | QG101.14 31.43,46.02 31.43,53.64 | R103.2 16.51,68.56 | R102.2 19.68,64.12
  Bottom 0.406: 107.95,37.76 LED213.A | 107.95,32.68 LED206.A | 107.95,27.6 LED214.A | 107.95,22.52 LED216.A | 107.95,17.44 LED208.A | 107.95,12.36 LED215.A
  Bottom 0.61: 50.48,51.1 50.48,49.83 52.07,48.24 52.07,47.92 R202.2 52.07,42.84 R201.2
  Bottom 0.813: V101.OUT 18.1,83.8 16.51,82.21 v16.51,79.99 v16.51,78.72 v16.51,77.45 v16.51,76.18 | QG101.14 28.89,41.89 30.8,39.98 v30.8,4.74 32.07,3.47 40.64,3.47 | IC101.10 45.09,53.64 46.35,54.91 50.48,54.91 51.12,54.27 51.12,51.73 50.48,51.1 IC101.30 | V101.OUT 22.23,85.7 26.35,89.83 31.11,89.83 31.75,89.2 IC102.3 47.43,89.2 48.7,90.47 C104.+ | 107.95,7.28 107.95,12.36 107.95,17.44 107.95,22.52 107.95,27.6 107.95,32.68 107.95,37.76 107.95,41.89 108.9,42.84 LED205.A 109.86,43.16 v112.08,43.16 v113.35,43.16 v113.35,44.43 v113.35,59.99 v113.35,65.07 v113.35,70.15 v113.35,71.42 v113.35,72.69 v113.35,75.23 v113.35,80.31 v113.35,85.7 v113.35,90.79 v113.35,95.55 113.35,97.14 112.08,98.41 86.04,98.41 85.09,97.45 85.09,93.33 83.5,91.74 79.06,91.74 73.98,96.82 v63.5,96.82 v62.23,96.82 v60.96,96.82 v59.05,96.82 v57.78,96.82 v56.52,96.82 v55.24,96.82 v53.98,96.82 51.12,96.82 48.58,94.28 48.58,92.06 | v63.82,7.92 63.82,5.06 63.18,4.43 C202.1 IC103.8 IC103.7 | IC104.17 IC103.3 50.48,9.19 53.02,6.65 IC103.7 | 40.64,3.47 43.18,3.47 44.77,1.89 51.75,1.89 53.02,3.15 IC103.7 | SV101.2 40.64,3.47 | C105.1 25.4,80.94 24.77,81.58 22.86,81.58 22.23,82.21 V101.OUT | LED207.A 107.95,7.28 | 107.95,7.28 107.95,2.2 107.31,1.57 71.75,1.57 70.8,2.52 DC201.2 | C102.1 52.07,47.92
+18V  (via drill 0.5)
  Top 0.813: R106.1 D103.C
  Top 1.27: D102.A 19.05,87.93 12.38,81.9 4.45,81.9 3.17,80.62 3.17,69.83 7.62,65.39 7.62,43.79 16.19,35.22 v16.19,33.32 v16.19,32.05 v16.19,30.78 v16.19,13.32 v16.19,12.04 v16.19,10.78
  Bottom 0.813: R106.1 33.02,90.47 32.07,91.42 25.08,91.42 21.59,87.93 D102.A
  Bottom 1.27: v16.19,12.04 9.46,12.04 X101.6 | v16.19,10.78 v16.19,12.04 | v16.19,12.04 v16.19,13.32 | X102.6 16.13,31.98 v16.19,32.05 | v16.19,32.05 v16.19,33.32 | v16.19,32.05 v16.19,30.78
/CS-MBC  (via drill 0.5)
  Top 0.406: IC104.16 47.94,19.66 49.21,20.93 49.21,24.43 44.13,29.51 v44.13,66.34
  Bottom 0.406: R103.1 30.48,68.56 32.7,66.34 IC101.5 v44.13,66.34
/CS-MEM  (via drill 0.5)
  Top 0.406: IC103.1 55.56,15.86 51.75,19.66 51.75,27.92 50.16,29.51 46.04,29.51 45.09,30.46 v45.09,63.8 v45.09,71.42
  Bottom 0.406: v45.09,71.42 IC101.38 | R102.1 31.43,65.7 32.07,65.07 38.73,65.07 40.01,63.8 v45.09,63.8
/INT  (via drill 0.5)
  Top 0.406: IC104.12 37.78,19.66 39.05,20.93 39.05,24.75 36.51,27.29 v36.51,71.42
  Bottom 0.406: v36.51,71.42 IC101.3
/RES  (via drill 0.5)
  Top 0.406: SV101.5 35.56,10.46 33.97,12.04 33.97,18.39 36.51,20.93 36.51,25.7 35.56,26.65 v35.56,56.18 | v46.04,56.18 v46.04,68.88
  Bottom 0.406: C103.1 26.04,62.21 26.67,62.84 R101.1 29.84,59.35 33.02,56.18 IC101.9 v35.56,56.18 v46.04,56.18 | v46.04,68.88 IC101.37
AREF
  Bottom 0.406: IC101.32 C101.1
CAN-H  (via drill 0.5)
  Top 0.61: v13.02,13.95 v13.02,33.95 | v25.72,46.65 v25.72,53.95
  Bottom 0.61: IC105.7 25.72,11.09 24.77,12.04 20.32,12.04 17.78,14.59 13.65,14.59 13.08,14.01 X101.8 9.46,14.01 9.53,13.95 v13.02,13.95 | v13.02,33.95 13.02,34.02 | 13.02,34.02 X102.8 | 13.02,34.02 13.02,46.02 13.65,46.65 v25.72,46.65 | v25.72,53.95 OK101.4
CAN-L  (via drill 0.5)
  Top 0.61: v23.18,13.32 IC105.6 | v11.75,15.54 v11.75,35.54
  Bottom 0.61: X101.7 7.62,14.9 8.26,15.54 v11.75,15.54 13.02,15.54 13.34,15.86 18.1,15.86 20.64,13.32 v23.18,13.32 | X102.7 7.62,35.22 7.94,35.54 v11.75,35.54 11.75,47.29 12.7,48.24 R108.2
GND  (via drill 0.5)
  Top 0.406: 52.39,92.06 C104.-
  Top 0.61: IC103.4 47.94,10.46 48.58,9.82 61.28,9.82
  Top 0.813: IC101.31 C101.2 | C104.- 50.67,90.47 R107.2 44.77,85.39 | 44.77,85.39 44.77,85.07 43.81,84.12 IC102.1 | 24.77,86.66 V101.GND | 24.77,86.66 28.26,86.66 30.8,84.12 C106.2 IC102.1 | D101.K 11.43,77.13 20.95,86.66 24.77,86.66 | 61.28,93.64 OK201.9 | 61.28,88.56 61.28,93.64 | 61.28,83.48 61.28,88.56 | 61.28,78.4 61.28,83.48 | 61.28,72.37 61.28,78.4 | 61.28,66.97 61.28,72.37 | 61.28,62.21 61.28,66.97 | 61.28,57.13 61.28,62.21 | 61.28,51.1 61.28,57.13 | 61.28,51.1 61.28,46.02 | 61.28,46.02 61.28,40.94 | 61.28,40.94 61.28,35.86 | 61.28,24.75 61.28,19.66 | 61.28,19.66 61.28,14.59 | 61.28,14.59 OK204.15 | 61.28,19.66 OK204.13 | 61.28,24.75 OK204.11 | 61.28,29.82 OK204.9 | 61.28,29.82 61.28,24.75 | 61.28,35.86 OK203.15 | 61.28,35.86 61.28,29.82 | 61.28,40.94 OK203.13 | 61.28,46.02 OK203.11 | OK203.9 61.28,51.1 | 61.28,88.56 OK201.11 | 61.28,83.48 OK201.13 | 61.28,78.4 OK201.15 | 61.28,72.37 OK202.9 | OK202.11 60.96,67.29 61.28,66.97 | 61.28,62.21 OK202.13 | 61.28,57.13 OK202.15 | 61.28,93.64 v61.28,95.23 v60.01,95.23 v58.74,95.23 55.56,95.23 52.39,92.06 | C107.- 50.16,85.39 44.77,85.39 | 61.28,14.59 61.28,9.82 61.28,6.97 | 61.28,6.97 61.28,6.65 62.87,5.06 DC201.1 | SV101.6 29.53,6.33 28.26,7.6 IC105.8 28.26,11.09 25.72,13.63 IC105.2 25.72,18.08 26.35,18.71 32.07,18.71 32.7,19.35 IC104.9 29.53,23.16 24.45,28.24 QG101.7 | C105.2 36.83,80.94 38.1,82.21 IC102.1 | C202.2 61.28,6.97
  Top 1.27: v5.4,70.47 v9.21,70.47 17.14,62.53 17.14,59.99 | 17.14,59.99 v17.14,49.83 17.14,39.03 21.27,34.9 QG101.7 18.41,25.38 18.41,8.87 16.19,6.65 | C103.2 17.14,59.99 | X101.S@2 11.9,2.35 16.19,6.65 | 16.19,6.65 12.89,9.95 X101.4 X101.5 3.94,10.97 1.91,13 1.91,20.62 | X102.4 X102.3 7.62,30.14 | X102.4 X102.5 | X101.S@1 X102.S@2 8.51,20.68 8.57,20.62 1.91,20.62 | 1.91,30.14 7.62,30.14 | 7.62,30.14 9.21,30.14 X102.4 | X102.S@1 8.51,39.41 6.99,40.94 3.17,40.94 1.91,39.67 1.91,30.14 | 1.91,30.14 1.91,20.62
  Bottom 0.813: IC101.31 46.67,53.64 44.13,51.1 IC101.11 33.02,51.1 31.75,49.83 v17.14,49.83 12.06,49.83 8.57,46.33 8.57,38.4 | 73.98,42.21 IC202.2 | 73.98,42.21 IC202.3 | IC201.2 IC201.3 | IC201.2 IC201.1 73.98,71.42 73.03,72.37 73.03,94.59 72.39,95.23 v61.28,95.23 v60.01,95.23 v58.74,95.23 | 76.2,52.05 IC201.8 | 76.2,52.05 76.2,42.21 | 76.2,42.21 73.98,42.21 | IC201.2 75.56,67.29 76.2,66.66 76.2,52.05 | 52.39,51.1 OK203.9 | C101.2 52.39,51.1 | 76.2,42.21 76.2,28.87 75.56,28.24 IC202.8 73.98,26.33 73.03,25.38 73.03,8.87 72.07,7.92 69.22,7.92 68.26,6.97 DC201.1 | C102.2 52.39,51.1
  Bottom 1.27: 3.17,77.13 3.17,86.46 5.28,88.56 CON101.2 | 3.17,77.13 D101.K | 3.17,77.13 3.17,72.69 v5.4,70.47 v6.67,70.47 v7.94,70.47 v9.21,70.47
GNDA  (via drill 0.5)
  Top 2.184: 116.2,50.14 X203.1 | 116.2,50.14 X203.2 | v110.17,50.14 v108.9,50.14 | v110.17,50.14 v111.44,50.14 | v110.17,50.14 116.2,50.14
  Bottom 0.813: D216.A 85.41,4.74 81.92,8.24 81.92,13.95 81.28,14.59 C201.2 76.83,14.59 74.3,12.04 74.3,6.65 73.34,5.7 DC201.3
  Bottom 2.184: v110.17,50.14 v111.44,50.14 | v110.17,50.14 v108.9,50.14 | D216.A D215.A D214.A D213.A D212.A D211.A D210.A D209.A 88.58,50.14 | D201.A D202.A D203.A D204.A D205.A D206.A D207.A D208.A 88.58,50.14 | 88.58,50.14 v110.17,50.14
I00
  Top 0.406: IC101.35 50.16,63.8 50.8,64.43 50.8,80.31 54.93,84.44 54.93,89.52 56.52,91.1 OK201.10
I01
  Top 0.406: IC101.34 51.12,61.26 51.75,61.89 51.75,79.99 57.78,86.02 OK201.12
I02
  Top 0.406: IC101.33 51.75,58.72 52.7,59.67 52.7,79.67 53.98,80.94 OK201.14
I03  (via drill 0.5)
  Top 0.406: v40.32,67.61 v40.32,43.48
  Bottom 0.406: v40.32,43.48 IC101.14 | v40.32,67.61 53.98,67.61 54.61,68.24 54.61,73.96 56.52,75.86 OK201.16
I04  (via drill 0.5)
  Top 0.406: v41.27,65.07 v41.27,40.94
  Bottom 0.406: v41.27,40.94 IC101.15 | v41.27,65.07 54.93,65.07 55.56,65.7 55.56,68.88 56.52,69.83 OK202.10
I05  (via drill 0.5)
  Top 0.406: v42.23,62.53 v42.23,38.4
  Bottom 0.406: v42.23,38.4 IC101.16 | v42.23,62.53 54.93,62.53 57.15,64.75 OK202.12
I06  (via drill 0.5)
  Top 0.406: v43.18,59.99 v43.18,35.86
  Bottom 0.406: v43.18,35.86 IC101.17 | v43.18,59.99 57.15,59.99 57.47,59.67 OK202.14
I07  (via drill 0.5)
  Top 0.406: v46.35,33.32 46.35,51.41 47.31,52.37 54.29,52.37 56.52,54.59 OK202.16
  Bottom 0.406: v46.35,33.32 IC101.18
I08
  Top 0.406: IC101.29 49.53,48.56 51.44,46.65 54.93,46.65 56.83,48.56 OK203.10
I09
  Top 0.406: IC101.28 49.21,46.02 49.53,45.7 54.93,45.7 57.47,43.48 OK203.12
I10
  Top 0.406: IC101.26 51.75,40.94 54.29,38.4 OK203.14
I11
  Top 0.406: IC101.25 51.75,38.4 56.83,33.32 OK203.16
I12
  Top 0.406: IC101.24 52.39,35.86 53.66,34.59 53.66,28.87 55.24,27.29 OK204.10
I13
  Bottom 0.406: IC101.21 54.29,28.24 56.52,26.02 56.52,22.84 57.15,22.21 OK204.12
I14
  Bottom 0.406: IC101.19 43.18,30.78 46.99,26.97 54.29,26.97 55.56,25.7 55.56,18.71 57.15,17.12 OK204.14
I15
  Bottom 0.406: IC101.20 44.45,28.24 46.67,26.02 53.98,26.02 54.61,25.38 54.61,15.54 58.1,12.04 OK204.16
LED-G
  Top 0.406: IC101.2 32.7,74.28 R105.1
LED-R
  Bottom 0.61: IC101.4 32.38,68.88 R104.1
MISO  (via drill 0.5)
  Top 0.406: v39.37,61.26 39.37,32.05 46.67,24.75 46.67,20.93 45.4,19.66 IC104.15
  Bottom 0.406: SV101.1 43.5,8.87 45.4,10.78 IC104.15 45.4,17.12 46.04,17.76 51.12,17.76 51.75,17.12 51.75,13.63 53.02,12.36 IC103.2 | IC101.7 v39.37,61.26
MOSI  (via drill 0.5)
  Top 0.406: IC103.5 47.94,6.97 47.31,7.6 39.37,7.6 SV101.4 | IC104.14 42.86,19.66 44.13,20.93 44.13,24.75 38.42,30.46 v38.42,63.8
  Bottom 0.406: SV101.4 39.37,7.6 39.37,10.14 42.86,13.63 IC104.14 | v38.42,63.8 IC101.6
N$1  (via drill 0.5)
  Top 0.406: v32.38,13.32 29.84,13.32 28.26,14.9 IC105.1
  Bottom 0.406: IC104.1 53.02,21.25 52.07,20.3 38.73,20.3 36.51,18.08 36.51,13.95 35.88,13.32 v32.38,13.32
N$2  (via drill 0.5)
  Top 0.406: v29.21,12.04 v32.38,12.04 | v50.48,18.71 IC104.2
  Bottom 0.406: IC105.4 20.64,15.22 21.59,14.27 26.99,14.27 v29.21,12.04 | v32.38,12.04 37.15,12.04 39.05,13.95 39.05,18.08 39.69,18.71 v50.48,18.71
N$4
  Top 0.406: OK101.3 29.84,51.41 R108.1
N$6
  Bottom 0.813: C107.+ 44.77,87.93 33.34,87.93 | 33.34,87.93 D102.C 28.57,87.93 27.3,86.66 V101.IN | C106.1 33.34,87.93
N$7
  Top 0.406: R109.2 19.68,53.95 OK101.1
  Bottom 0.61: OK101.1 4.13,53.95 1.59,51.41 1.59,11.09 3.81,8.87 7.56,8.87 X101.3
N$9
  Bottom 0.406: D101.AR 8.57,74.59 11.75,71.42 R104.2
N$13
  Bottom 0.406: D101.AG 8.89,79.67 10.79,77.77 10.79,75.23 11.75,74.28 R105.2
N$15  (via drill 0.5)
  Top 0.406: IC201.9 84.77,52.05 85.72,51.1 93.03,51.1 v96.2,54.27
  Bottom 0.406: v96.2,54.27 97.16,55.22 106.05,55.22 107.31,53.95 108.9,53.95 109.54,54.59 LED203.K
N$16  (via drill 0.5)
  Top 0.406: RN204.6 83.19,17.12 84.14,16.17 84.14,14.59 85.09,13.63 v103.82,13.63
  Top 0.813: v103.82,13.63 114.62,13.63 116.2,12.04 X202.7
  Bottom 0.813: D215.C v103.82,13.63
N$17
  Top 0.406: RN204.8 72.71,12.04 73.34,12.68 73.34,15.54 73.98,16.17 82.55,16.17 83.19,15.54 83.19,9.19 83.82,8.55 94.61,8.55 98.42,4.74 D216.C
  Top 0.813: X202.8 116.2,7.28 114.94,8.55 107.63,8.55 D216.C
N$18
  Top 0.406: RN204.2 71.75,27.29 72.07,26.97 84.45,26.97 86.36,25.06 98.74,25.06 100.97,22.84 104.14,22.84
  Top 0.813: X202.5 116.2,22.52 114.94,23.79 107.63,23.79 106.68,22.84 104.14,22.84 D213.C
N$19  (via drill 0.5)
  Top 0.406: RN204.4 72.39,22.21 73.03,22.84 73.03,25.38 73.66,26.02 82.55,26.02 85.09,23.48 85.09,20.3 85.72,19.66 v103.82,19.66
  Top 0.813: v103.82,19.66 107.63,19.66 108.58,18.71 114.94,18.71 116.2,17.44 X202.6
  Bottom 0.813: D214.C v103.82,19.66
N$20
  Top 0.406: RN203.6 72.07,37.13 84.77,37.13 85.09,36.81 94.61,36.81 96.52,34.9 104.14,34.9
  Top 0.813: X202.3 116.2,32.68 114.94,33.95 107.63,33.95 106.68,34.9 104.14,34.9 D211.C
N$21
  Top 0.406: RN203.8 72.07,32.05 83.82,32.05 85.09,30.78 94.61,30.78 96.52,28.87 105.09,28.87
  Top 0.813: X202.4 116.2,27.6 114.94,28.87 105.09,28.87 D212.C
N$22
  Top 0.406: RN203.2 100.33,48.56 101.92,46.97 D209.C
  Top 0.813: X202.1 115.25,42.52 115.25,45.06 114.62,45.7 110.81,45.7 109.54,46.97 D209.C
N$23
  Top 0.406: RN203.4 72.07,42.21 83.19,42.21 86.36,39.03 97.79,39.03 99.69,40.94 D210.C
  Top 0.813: X202.2 116.2,37.76 114.94,39.03 108.58,39.03 106.68,40.94 D210.C
N$24
  Top 0.406: RN202.6 70.8,59.99 71.75,60.94 85.09,60.94 85.41,61.26 97.47,61.26 99.69,59.03 D207.C
  Top 0.813: X201.7 115.89,63.48 113.35,63.48 111.12,61.26 108.9,61.26 106.36,59.03 D207.C
N$25
  Top 0.406: RN202.8 72.07,55.86 84.14,55.86 84.45,56.18 110.49,56.18 110.49,55.86
  Top 0.813: X201.8 113.35,58.72 110.49,55.86 110.49,54.59 108.9,53 D208.C
N$26
  Top 0.406: RN202.2 71.44,69.83 73.03,71.42 84.45,71.42 85.72,72.69 99.06,72.69 100.65,71.1 D205.C
  Top 0.813: D205.C 106.36,71.1 106.68,71.42 110.49,71.42 113.03,73.96 X201.5
N$27
  Top 0.406: RN202.4 70.8,65.07 71.75,66.02 84.14,66.02 85.41,67.29 96.2,67.29 98.42,65.07 D206.C
  Top 0.813: D206.C 106.36,65.07 107.63,66.34 112.71,66.34 115.25,68.88 X201.6
N$28
  Top 0.406: RN201.6 72.39,80.94 74.3,82.85 82.23,82.85 83.82,81.26 96.84,81.26 98.74,83.17 D203.C
  Top 0.813: X201.3 113.35,84.12 110.81,81.58 108.58,81.58 107,83.17 D203.C
N$29
  Top 0.406: RN201.8 72.71,75.86 74.93,73.64 82.55,73.64 83.82,74.91 94.3,74.91 96.52,77.13 D204.C
  Top 0.813: X201.4 113.03,79.04 110.49,76.5 107.31,76.5 106.68,77.13 106.36,77.13 D204.C
N$30
  Top 0.406: RN201.2 75.88,91.1 77.47,92.69 103.5,92.69 103.82,92.37 104.78,91.74
  Top 0.813: X201.1 113.35,94.28 110.81,91.74 104.78,91.74 104.46,91.74 103.82,92.37 D201.C
N$31  (via drill 0.5)
  Top 0.406: v108.27,55.22 85.09,55.22 84.45,54.59 IC201.10
  Bottom 0.406: v108.27,55.22 108.27,61.26 LED211.K
N$32
  Top 0.406: OK204.2 RN204.7
N$35
  Top 0.406: OK204.4 RN204.5
N$36
  Top 0.406: OK204.6 RN204.3
N$37
  Top 0.406: OK204.8 RN204.1
N$38
  Top 0.406: OK203.2 RN203.7
N$39
  Top 0.406: OK203.4 RN203.5
N$40
  Top 0.406: OK203.6 RN203.3
N$41
  Top 0.406: OK203.8 RN203.1
N$42
  Top 0.406: OK202.2 RN202.7
N$43
  Top 0.406: OK202.4 RN202.5
N$44
  Top 0.406: OK202.6 RN202.3
N$45
  Top 0.406: OK202.8 RN202.1
N$46
  Top 0.406: OK201.2 RN201.7
N$47
  Top 0.406: RN201.4 96.84,86.02 100.01,89.2 D202.C
  Top 0.813: X201.2 113.35,89.2 110.81,86.66 104.78,86.66 103.82,87.61 D202.C
N$48
  Top 0.406: OK201.4 RN201.5
N$49  (via drill 0.5)
  Top 0.406: v86.04,42.84 107,42.84 LED205.K | v78.42,39.67 77.47,39.67 76.2,38.4 IC202.4
  Bottom 0.406: v86.04,42.84 82.87,39.67 v78.42,39.67
N$50  (via drill 0.5)
  Top 0.406: v69.22,73.96 73.34,73.96 v74.61,72.69 | v85.09,91.1 v101.6,91.1
  Bottom 0.406: IC201.4 73.98,61.89 73.03,60.94 65.72,60.94 65.09,61.57 65.09,73.32 65.72,73.96 v69.22,73.96 | v74.61,72.69 78.11,72.69 81.6,76.18 81.6,87.61 v85.09,91.1 | v101.6,91.1 103.5,93.01 LED201.K
N$51  (via drill 0.5)
  Top 0.406: v77.47,59.67 IC201.5 | v92.71,86.98 v82.87,86.98
  Bottom 0.406: v77.47,59.67 77.47,70.78 82.87,76.18 v82.87,86.98 | LED209.K 107.31,87.93 106.36,86.98 v92.71,86.98
N$52  (via drill 0.5)
  Top 0.406: v78.42,57.13 IC201.6 | LED202.K 107.31,85.07 v84.14,85.07
  Bottom 0.406: v78.42,57.13 78.42,70.47 84.14,76.18 v84.14,85.07
N$53  (via drill 0.5)
  Top 0.406: v79.38,54.59 IC201.7 | LED210.K 107.95,79.36 v85.41,79.36
  Bottom 0.406: v79.38,54.59 79.38,70.15 80.96,71.73 85.41,75.86 v85.41,79.36
N$54  (via drill 0.5)
  Top 0.406: v107.31,57.13 IC201.11
  Bottom 0.406: v107.31,57.13 107.31,65.39 LED204.K
N$55  (via drill 0.5)
  Top 0.406: v84.77,59.67 IC201.12 | LED212.K 108.58,73.64 v84.77,73.64
  Bottom 0.406: v84.77,73.64 v84.77,59.67
N$56  (via drill 0.5)
  Top 0.406: v84.77,7.6 93.66,7.6 98.74,2.52 107.31,2.52 LED207.K
  Bottom 0.406: IC202.9 82.55,28.24 83.19,27.6 83.19,9.19 v84.77,7.6
N$57  (via drill 0.5)
  Top 0.406: LED213.K 107,37.76 85.41,37.76 85.09,38.08 83.5,39.67 80.01,39.67 78.74,38.4 v78.42,38.4 | IC202.5 v78.42,35.86
  Bottom 0.406: v78.42,35.86 v78.42,38.4
N$58
  Top 0.406: LED206.K 107.95,31.73 85.72,31.73 82.87,34.59 77.47,34.59 76.2,33.32 IC202.6
N$59
  Top 0.406: LED214.K 108.27,26.33 86.68,26.33 85.72,27.29 83.5,29.51 77.47,29.51 76.2,30.78 IC202.7
N$60  (via drill 0.5)
  Top 0.406: v85.09,12.68 106.68,12.68 LED215.K
  Bottom 0.406: IC202.10 83.19,30.78 84.14,29.82 84.14,13.63 v85.09,12.68
N$61  (via drill 0.5)
  Top 0.406: v86.36,18.71 106.68,18.71 107.95,17.44 107.95,15.86 108.9,14.9 LED208.K
  Bottom 0.406: IC202.11 84.14,33.32 85.09,32.36 85.09,19.98 v86.36,18.71
N$62  (via drill 0.5)
  Top 0.406: IC202.12 83.82,35.86 87,32.68 v97.16,32.68 | v97.16,22.21 98.42,20.93 108.58,20.93 LED216.K
  Bottom 0.406: v97.16,32.68 v97.16,22.21
N$64
  Top 0.406: OK201.6 RN201.3
N$65
  Top 0.406: OK201.8 RN201.1
PLUGGED  (via drill 0.5)
  Top 0.406: v13.34,76.5 v13.34,73.01 | v40.01,73.96 IC101.39
  Bottom 0.406: CON101.3 10.65,79.18 v13.34,76.5 | v13.34,73.01 31.11,73.01 31.43,72.69 38.73,72.69 v40.01,73.96
Q-CLK
  Top 0.61: IC101.13 33.02,46.02 30.8,43.79 30.8,28.24 | 30.8,28.24 QG101.8 | 30.8,28.24 30.8,27.6 32.38,26.02 34.29,26.02 35.24,25.06 IC104.8
SCK  (via drill 0.5)
  Top 0.406: IC103.6 50.48,7.6 49.21,8.87 45.72,8.87 44.13,10.46 38.42,10.46 38.1,10.14 SV101.3 | IC104.13 40.32,19.66 41.59,20.93 41.59,24.75 37.47,28.87 v37.47,58.72
  Bottom 0.406: SV101.3 38.1,11.09 40.32,13.32 IC104.13 | v37.47,58.72 IC101.8
SCL  (via drill 0.5)
  Top 0.406: IC201.14 83.19,64.75 85.09,62.84 107.31,62.84 108.27,63.8 v111.76,63.8 | v111.76,52.37 111.44,52.05 107.31,52.05 105.41,50.14 v86.04,50.14 | v78.74,47.29 v72.39,47.29
  Bottom 0.406: IC101.22 52.39,30.78 53.66,29.51 R201.1 56.2,28.55 64.45,28.55 65.09,29.19 65.09,46.65 65.72,47.29 v72.39,47.29 | v111.76,63.8 v111.76,52.37 | v86.04,50.14 85.41,49.51 85.41,43.79 82.55,40.94 IC202.14 79.69,40.94 78.74,41.89 v78.74,47.29
SDA  (via drill 0.5)
  Top 0.406: v79.69,49.83 v72.39,49.83
  Bottom 0.406: IC101.23 R202.1 53.66,31.73 62.87,31.73 64.14,33 64.14,48.24 65.72,49.83 v72.39,49.83 | IC201.15 83.5,67.29 83.82,66.97 83.82,43.79 83.5,43.48 IC202.15 80.64,43.48 79.69,44.43 v79.69,49.83
SPG
  Bottom 0.61: R106.2 R107.1 44.77,78.72 46.99,76.5 IC101.40
V+
  Top 0.813: OK201.7 65.72,91.1 65.09,90.47 65.09,86.02 | 65.09,86.02 65.09,80.94 | 65.09,80.94 65.09,75.86 | 65.09,75.86 65.09,69.83 | 65.09,69.83 65.09,64.75 | 65.09,64.75 65.09,59.67 | 65.09,59.67 65.09,54.59 | 65.09,54.59 65.09,48.56 | 65.09,48.56 65.09,43.48 | 65.09,43.48 65.09,38.08 | 65.09,38.08 65.09,33.32 | 65.09,33.32 65.09,27.29 | 65.09,27.29 65.09,22.21 | 65.09,22.21 65.09,16.81 | 65.09,16.81 65.09,12.04 | 65.09,12.04 65.09,9.82 65.72,9.19 74.3,9.19 75.88,7.6 DC201.4 | 65.09,12.04 OK204.1 | OK204.3 65.41,17.12 65.09,16.81 | 65.09,22.21 OK204.5 | 65.09,27.29 OK204.7 | OK203.3 65.41,38.4 65.09,38.08 | 65.09,43.48 OK203.5 | 65.09,48.56 OK203.7 | 65.09,59.67 OK202.3 | 65.09,64.75 OK202.5 | 65.09,69.83 OK202.7 | 65.09,75.86 OK201.1 | 65.09,80.94 OK201.3 | 65.09,86.02 OK201.5 | 65.09,54.59 OK202.1 | 65.09,33.32 OK203.1
  Bottom 0.813: C201.1 76.83,12.04 75.88,11.09 DC201.4
V-NETZTEIL1
  Bottom 1.27: CON101.1 19.05,90.47 21.91,93.33 D103.A

### Text on the board
Bottom: MBCAN-Projekt | (c) Dr.-Ing. Th. Wiesner | 20.10.2022 | mbc88.brd | bottom
tNames: HW: 23.11.25 | 1 | 2 | +18V | DC | 3 | Status | 4 | 5 | 6 | (c) Dr.-Ing. Th. Wiesner | MBCAN-Projekt | 7 | 8 | 9 | IN | 10 | 11 | 12 | 13 | OUT | 14 | 15 | 16 | mbc-90-AC